# Altium project Half Bridge.PrjPcb
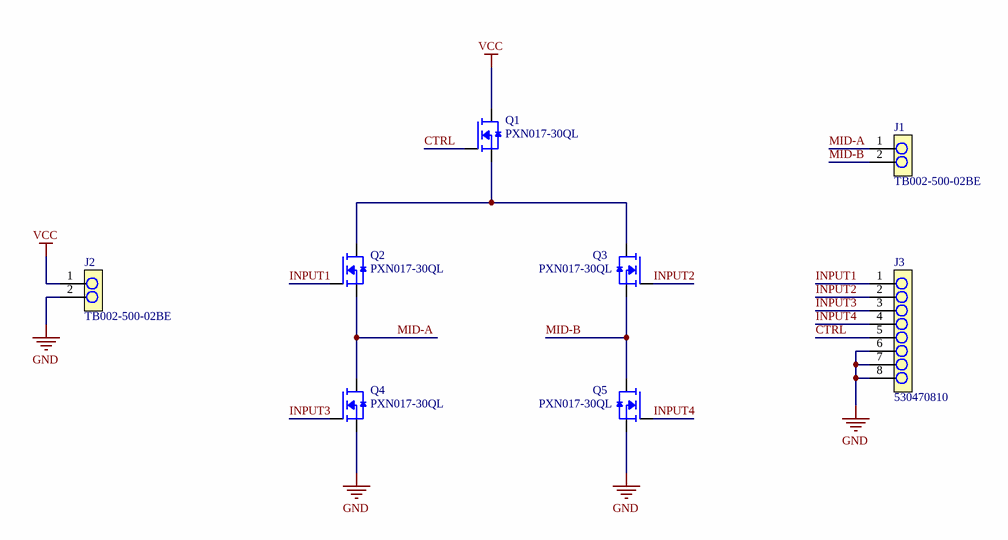
[diagram p0: Half Bridge.SchDoc]
Approved By: Dinura Pasan; Checked By: Dinura Pasan; Company Address1: Address Line1; Company Address2: Address Line2; Company Address3: Matara; Company Address4: Sri Lanka; Company Name: DP_Tronics; Designed By: Dinura Pasan; Encryption Code: EVC1267; Logo Path: No Logo; Maintained By: Dinura Pasan; Privacy State: Confidential; Project Engineer: Dinura Pasan; Project Organization: DP_Tronics; Revision Number: 1.0.0A; Schematic Title01: Half Bridge; Software Version: #NAME?; Started Date: 9/12/2026; Started Time: 22:30
1 sheet, 8 parts. Net scope: global (net labels, ports and power ports of the same name join across sheets).
Board file: Half Bridge.PcbDoc

## Sheet Half Bridge.SchDoc: =Schematic Title01
size A; Date: 9/12/2026; ApprovedBy: Dinura Pasan; CheckedBy: Dinura Pasan; Author: Dinura Pasan; CompanyName: DP_Tronics; DrawnBy: Dinura Pasan; Engineer: Dinura Pasan; Organization: DP_Tronics; Address1: Address Line1; Address2: Address Line2; Address3: Matara; Address4: Sri Lanka; DocumentNumber: 01/01; Revision: 1.0.0A; SheetNumber: 1; SheetTotal: 1; SPICEModelCacheMNIZHQNX: <root> / <DocumentId>MNIZHQNX</DocumentId> / <CacheFrame Number="0"> / <Model Name="pxn017-30ql" Kind="CKT"> / <Text>.SUBCKT PXN017-30QL D G S / * Package impedance / LD D 5 200.0p / RLD2 D 5 502.7m / RLD1 5 4 20.80u / LG G 1 915.4p / RLG G 1 2.301 / LS S 8 665.7p / RLS2 S 8 1.673 / RLS1 8 7 3.314m / * Drain,gate and source resistances / RD 3 4 10.01m TC= 3.324m,1.004n / RG 1 2 3.000 / RS 6 7 1.000u / * Body Diode / RBD 9 4 6.050m TC= 4.000m,23.00u / DBD 7 9 D_DBD / RDS 7 4 12.15G TC= -5.000m / * Internal MOS / M1 3 2 6 6 MINT / * Gate leakage and gate capacitance / RGS 2 6 174.4G / CGS 2 6 329.0p / * CGD / C11 11 12 1E-12 / V11 11 0 0Vdc / G11 3 2 VALUE {V(13,0)*I(V11)} / E11 12 0 3 2 1 / E12 13 0 TABLE {V(12)} / + (-10.0,135.8) / + (-2.5,135.8) / + (0.1,38.98) / + (0.2,73.41) / + (0.5,64.49) / + (1.0,56.29) / + (2.0,46.47) / + (3.0,40.02) / + (4.0,35.16) / + (5.0,31.26) / + (6.0,28.37) / + (8.0,25.04) / + (10.0,23.5) / + (12.0,22.66) / + (15.0,21.94) / + (20.0,21.28) / + (24.0,20.94) / .MODEL MINT NMOS Vto= 2.205 Kp= 89.21 Nfs= 479.4G Eta= 0.000 / + Level= 3 Gamma= 0.000 Phi= 600.0m Is= 1.000E-24 UO= 600.0 / + Js= 0.000 Pb= 800.0m Cj= 0.000 Cjsw= 0.000 Cgso= 0.000 Cgdo= 0.000 Cgbo= 0.000 / + Tox= 100.0n Xj= 0.000 / + Vmax= 735.3 / .MODEL D_DBD D Bv= 33.12 Ibv= 250.0u Rs= 1.000u Is= 422.9f / + N= 1.000 M= 311.3m VJ= 320.5m Fc= 500.0m Cjo= 627.0p Tt= 18.50n / .ENDS PXN017-30QL</Text> / </Model> / </CacheFrame> / </root>; Time: 22:30; ImagePath: No Logo; Application_BuildNumber: #NAME?

### Parts
J1  TB002-500-02BE  [TB002-500-02BE]
J2  TB002-500-02BE  [TB002-500-02BE]
J3  530470810  [530470810]
Q1  PXN017-30QL  [NEXPERIA-MLPAK33]
Q2  PXN017-30QL  [NEXPERIA-MLPAK33]
Q3  PXN017-30QL  [NEXPERIA-MLPAK33]
Q4  PXN017-30QL  [NEXPERIA-MLPAK33]
Q5  PXN017-30QL  [NEXPERIA-MLPAK33]

### Nets
GND: J2.2 J3.6 J3.7 J3.8 Q4.S Q5.S
VCC: J2.1 Q1.D
CTRL: J3.5 Q1.G
INPUT1: J3.1 Q2.G
INPUT2: J3.2 Q3.G
INPUT3: J3.3 Q4.G
INPUT4: J3.4 Q5.G
MID-A: J1.1 Q2.S Q4.D
MID-B: J1.2 Q3.S Q5.D
NetQ1_S: Q1.S Q2.D Q3.D

### Notes on the sheet
- Engineer :
- Title :
- Size :
- A
- Prj :
- DrawnBy :
- Date :
- Description :
- Sheet :
- Edited :
- Revision :
- EN_Code :
- URL :

### Library data of the parts
J1 J2 = TB002-500-02BE: 2 Position Wire to Board Terminal Block Horizontal with Board 0.197" (5.00mm) Through Hole; Manufacturer 1: Same Sky; Description 1: 2~24 Poles, Screw Type, Horizontal, 5.0 Pitch, 22~12 (AWG), Terminal Block Connector; Category 1: Terminal Blocks; Approvals: CE, EN, IEC, UL, cUL; Current Rating: 15A; Mount 1: Screw; Number of Contacts: 2; Number of Levels: 1; Pitch: 5mm; Voltage Rating: 300V; Wire/Cable Gauge: 12AWG; Supplier 1: DigiKey; Supplier Part Number 1: 102-6145-ND; Manufacturer Part Number 1: TB002-500-02BE; RoHS 1: Compliant; Color: Blue; Export Control Classification Number (ECCN) Code: EAR99; Height: 10mm; Harmonized Tariff Schedule (HTS) Code: 8536.90.40.00; Introduction Date: 2024-10-09; Lifecycle Status: Production; Max Operating Temperature 1: 105°C; Min Operating Temperature 1: -40°C; Number of Pins 1: 2; Number of Rows: 1; Orientation: Horizontal; REACH SVHC: Affected; Width: 7.6mm; ComponentLink1URL: https://datasheet.octopart.com:443/TB002-500-02BE-Same-Sky-datasheet-181920249.pdf?src-supplier=Same+Sky; ComponentLink1Description: https://datasheet.octopart.com:443/TB002-500-02BE-Same-Sky-datasheet-181920249.pdf?src-supplier=Same+Sky
J3 = 530470810: Connector Header Through Hole 8 position 0.049" (1.25mm); Manufacturer 1: Molex; Manufacturer Part Number 1: 53047-0810; Manufacturer Lifecycle Status: ACTIVE; Description 1: Conn Shrouded Header (4 Sides) HDR 8 POS 1.25mm Solder ST Top Entry Thru-Hole PicoBlade Tray; Category 1: Headers and Wire Housings; Case/Package 1: 0810; Contact Resistance: 20mΩ; Current Rating: 1A; Dielectric Material: Polyamide; Gender: Male; Glow Wire Compliant: Non-compliant; Insulation Resistance: 100MΩ; Number of Circuits: 7; Number of Contacts: 8; Plating: Tin; Voltage Rating: 125V; Supplier 1: LCSC; Supplier Part Number 1: C240845; RoHS 1: Compliant; China RoHS: Compliant; Color: Natural; Contact Gender: Male; Contact Material: Tin; Contact Plating: Tin; Country of Origin: MX; Flammability Rating: UL94 V-0; Height: 4.4mm; Housing Color: Natural; Housing Material: Polyamide; Lead Free 1: Lead Free; Lead Pitch: 1.25mm; Lifecycle Status: Production; Max Operating Temperature 1: 85°C; Min Operating Temperature 1: -40°C; Mount 1: Through Hole; Number of Pins 1: 8; Number of Positions: 8; Number of Rows: 1; Orientation: Vertical; Pitch: 1.25mm; Radiation Hardening: No; REACH SVHC: Yes; Schedule B: 8536694040, 8536694040|8536694040|8536694040|8536694040|8536694040; Terminal Pitch: 1.25mm; Termination: Through Hole; Voltage Rating (AC): 125V; Voltage Rating (DC): 125V; ComponentLink1URL: https://datasheet.octopart.com:443/53047-0810-Molex-datasheet-138898128.pdf?src-supplier=Sager+Electronics; ComponentLink1Description: https://datasheet.octopart.com:443/53047-0810-Molex-datasheet-138898128.pdf?src-supplier=Sager+Electronics; ComponentLink2URL: https://datasheet.octopart.com:443/53047-0810-Molex-datasheet-13785974.pdf?src-supplier=Sager+Electronics; ComponentLink2Description: https://datasheet.octopart.com:443/53047-0810-Molex-datasheet-13785974.pdf?src-supplier=Sager+Electronics; ComponentLink3URL: https://sigma.octopart.com:443/138898116/technical_drawing/Molex-53047-0810.pdf?src-supplier=IHS; ComponentLink3Description: https://sigma.octopart.com:443/138898116/technical_drawing/Molex-53047-0810.pdf?src-supplier=IHS; ComponentLink4URL: https://datasheet.octopart.com:443/530470810-Molex-datasheet-8334299.pdf?src-supplier=Molex; ComponentLink4Description: https://datasheet.octopart.com:443/530470810-Molex-datasheet-8334299.pdf?src-supplier=Molex; ComponentLink5URL: https://datasheet.octopart.com:443/53047-0810-Molex-datasheet-38191.pdf?src-supplier=TME; ComponentLink5Description: https://datasheet.octopart.com:443/53047-0810-Molex-datasheet-38191.pdf?src-supplier=TME; ComponentLink6URL: https://datasheet.octopart.com:443/53047-0810-Molex-datasheet-154755961.pdf?src-supplier=Master+Electronics; ComponentLink6Description: https://datasheet.octopart.com:443/53047-0810-Molex-datasheet-154755961.pdf?src-supplier=Master+Electronics; ComponentLink7URL: https://datasheet.octopart.com:443/53047-0810-Molex-datasheet-101583379.pdf?src-supplier=Farnell; ComponentLink7Description: https://datasheet.octopart.com:443/53047-0810-Molex-datasheet-101583379.pdf?src-supplier=Farnell; ComponentLink8URL: https://datasheet.octopart.com:443/53047-0810-Molex-datasheet-14711287.pdf?src-supplier=Farnell; ComponentLink8Description: https://datasheet.octopart.com:443/53047-0810-Molex-datasheet-14711287.pdf?src-supplier=Farnell; ComponentLink9URL: https://datasheet.octopart.com:443/53047-0810-Molex-datasheet-5313088.pdf?src-supplier=Farnell; ComponentLink9Description: https://datasheet.octopart.com:443/53047-0810-Molex-datasheet-5313088.pdf?src-supplier=Farnell; ComponentLink10URL: https://datasheet.octopart.com:443/53047-0810-Molex-datasheet-33003857.pdf?src-supplier=Electro+Sonic; ComponentLink10Description: https://datasheet.octopart.com:443/53047-0810-Molex-datasheet-33003857.pdf?src-supplier=Electro+Sonic; ComponentLink11URL: https://datasheet.octopart.com:443/53047-0810-Molex-datasheet-62105410.pdf?src-supplier=Electro+Sonic; ComponentLink11Description: https://datasheet.octopart.com:443/53047-0810-Molex-datasheet-62105410.pdf?src-supplier=Electro+Sonic; ComponentLink12URL: https://datasheet.octopart.com:443/53047-0810-Molex-datasheet-23710544.pdf?src-supplier=Electro+Sonic; ComponentLink12Description: https://datasheet.octopart.com:443/53047-0810-Molex-datasheet-23710544.pdf?src-supplier=Electro+Sonic; ComponentLink13URL: https://datasheet.octopart.com:443/53047-0810-Molex-datasheet-140186535.pdf?src-supplier=RS+(Formerly+Allied+Electronics); ComponentLink13Description: https://datasheet.octopart.com:443/53047-0810-Molex-datasheet-140186535.pdf?src-supplier=RS+(Formerly+Allied+Electronics); ComponentLink14URL: https://datasheet.octopart.com:443/53047-0810-Molex-datasheet-120153815.pdf?src-supplier=RS+(Formerly+Allied+Electronics); ComponentLink14Description: https://datasheet.octopart.com:443/53047-0810-Molex-datasheet-120153815.pdf?src-supplier=RS+(Formerly+Allied+Electronics); ComponentLink15URL: https://datasheet.octopart.com:443/530470810-Molex-datasheet-137316104.pdf?src-supplier=Future+Electronics; ComponentLink15Description: https://datasheet.octopart.com:443/530470810-Molex-datasheet-137316104.pdf?src-supplier=Future+Electronics; ComponentLink16URL: https://datasheet.octopart.com:443/53047-0810-Molex-datasheet-33003856.pdf?src-supplier=Newark; ComponentLink16Description: https://datasheet.octopart.com:443/53047-0810-Molex-datasheet-33003856.pdf?src-supplier=Newark; ComponentLink17URL: https://datasheet.octopart.com:443/53047-0810-Molex-datasheet-21208624.pdf?src-supplier=Newark; ComponentLink17Description: https://datasheet.octopart.com:443/53047-0810-Molex-datasheet-21208624.pdf?src-supplier=Newark; ComponentLink18URL: https://datasheet.octopart.com:443/53047-0810-Molex-datasheet-17741837.pdf?src-supplier=Jameco; ComponentLink18Description: https://datasheet.octopart.com:443/53047-0810-Molex-datasheet-17741837.pdf?src-supplier=Jameco; ComponentLink19URL: https://datasheet.octopart.com:443/53047-0810-Molex-datasheet-144844.pdf?src-supplier=DigiKey; ComponentLink19Description: https://datasheet.octopart.com:443/53047-0810-Molex-datasheet-144844.pdf?src-supplier=DigiKey; ComponentLink20URL: https://datasheet.octopart.com:443/53047-0810-Molex-datasheet-100429.pdf?src-supplier=Mouser; ComponentLink20Description: https://datasheet.octopart.com:443/53047-0810-Molex-datasheet-100429.pdf?src-supplier=Mouser; ComponentLink21URL: http://sigma.octopart.com:80/16412934/rohs_statement/Molex-53047-0810.pdf?src-supplier=Compliance+Statements; ComponentLink21Description: http://sigma.octopart.com:80/16412934/rohs_statement/Molex-53047-0810.pdf?src-supplier=Compliance+Statements; ComponentLink22URL: http://sigma.octopart.com:80/reach_statement/Molex-company-74.pdf?src-supplier=Compliance+Statements; ComponentLink22Description: http://sigma.octopart.com:80/reach_statement/Molex-company-74.pdf?src-supplier=Compliance+Statements; ComponentLink23URL: http://sigma.octopart.com:80/rohs_statement/Molex-company-73.pdf?src-supplier=Compliance+Statements; ComponentLink23Description: http://sigma.octopart.com:80/rohs_statement/Molex-company-73.pdf?src-supplier=Compliance+Statements; ComponentLink24URL: http://sigma.octopart.com:80/conflict_mineral_statement/Molex-company-72.pdf?src-supplier=Compliance+Statements; ComponentLink24Description: http://sigma.octopart.com:80/conflict_mineral_statement/Molex-company-72.pdf?src-supplier=Compliance+Statements
Q1-Q5 = PXN017-30QL: N-Channel 30 V 7.9A (Ta), 20A (Tc) 1.7W (Ta), 10.9W (Tc) Surface Mount MLPAK33; Manufacturer: Nexperia; Configuration: Single; Drain Current - Continuous (Id): 12A; Drain Current - Pulsed (Id): 163A; Drain to Source Voltage (Vdss): 30V; Eco Plan: RoHS; Gate Charge (Qg) (Max) @ Vgs: 7.7 nC @ 10 V; Gate Level: Logic; Gate−Source Voltage(Vgss): ±20V; Input Capacitance (Ciss) (Max) @ Vds: 350 pF @ 15 V; Rds On (Max) @ Id, Vgs: 17.4mOhm @ 7.9A, 10V; Vgs(th) (Max) @ Id: 2.2V @ 250µA; Category: Power MOSFET; Channel Polarity: N-Channel; Datasheet: https://assets.nexperia.com/documents/data-sheet/PXN017-30QL.pdf; Operating Temperature: -55°C ~ 150°C (TJ); Power Dissipation (Max): 1.7W (Ta); Ratings: -; Series: TrenchMOS; Supplier 1: Digi-Key; Supplier Part Number 1: 1727-PXN017-30QLJCT-ND